# Altium project Remote_Sensor_Unit-v1.1.PrjPcb (part 2 of 4)

## Sheet Power_Sheet1.SchDoc
size A4; SheetNumber: 3; SheetTotal: 7
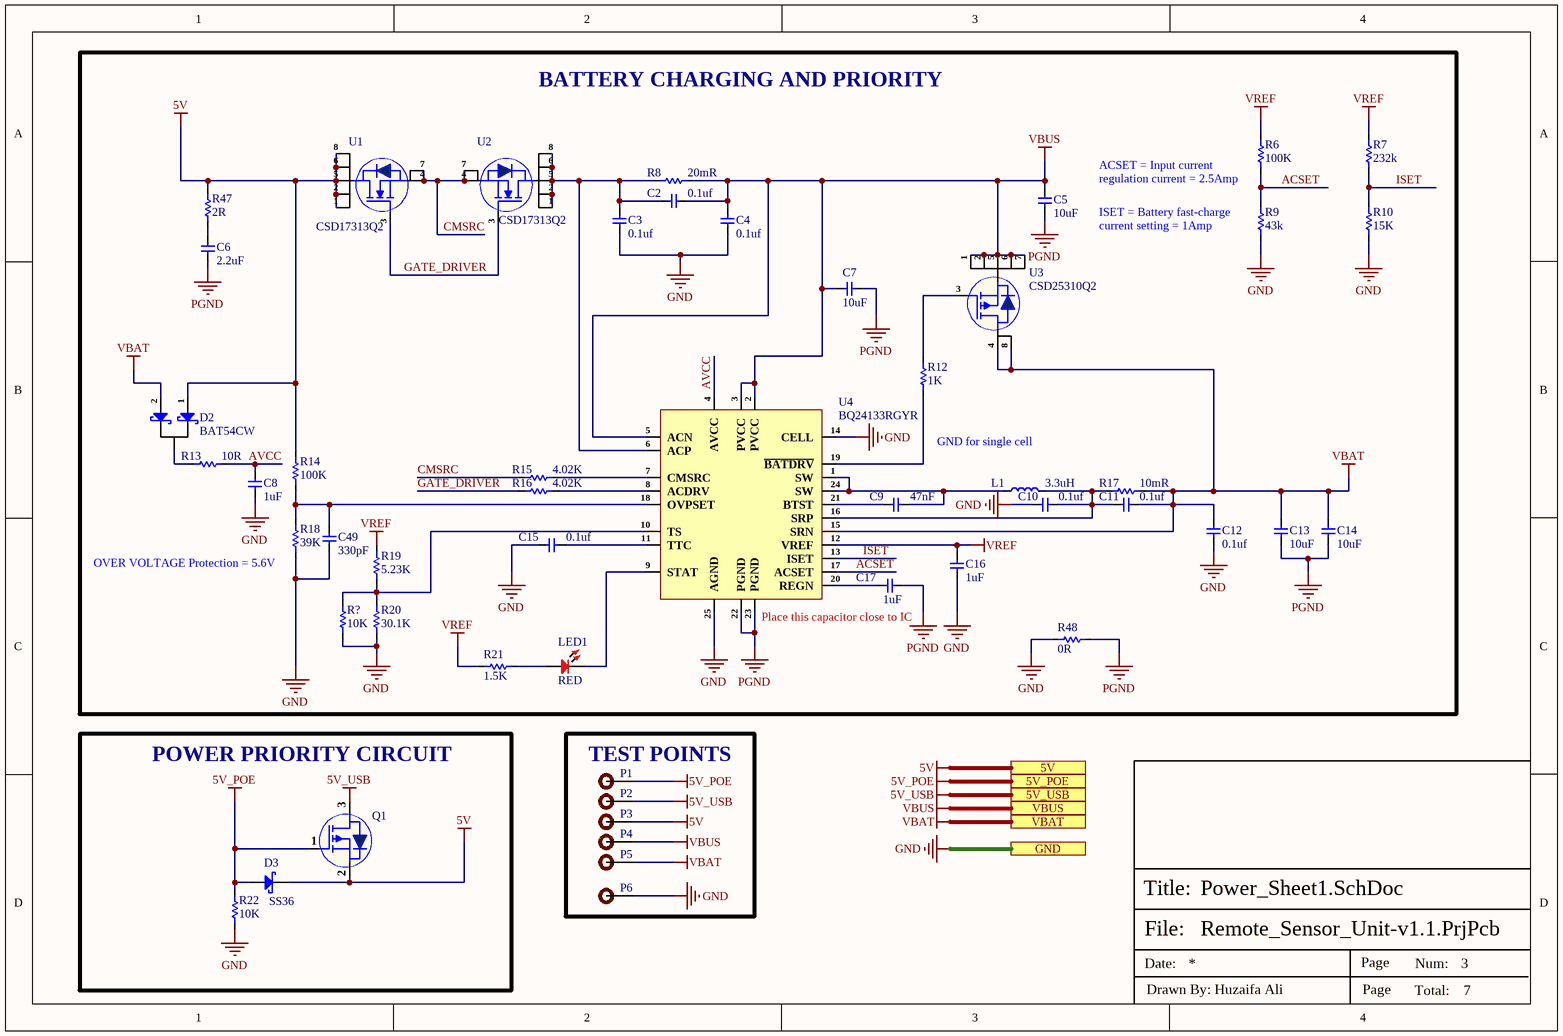
[diagram p2: Power_Sheet1.SchDoc]

### Parts
C2  0.1uf  [Cap-0402]
C3  0.1uf  [Cap-0402]
C4  0.1uf  [Cap-0402]
C5  10uF  [Cap-0402]
C6  2.2uF  [Cap-0805]
C7  10uF  [Cap-0402]
C8  1uF  [Cap-0402]
C9  47nF  [Cap-0402]
C10  0.1uf  [Cap-0402]
C11  0.1uf  [Cap-0402]
C12  0.1uf  [Cap-0402]
C13  10uF  [Cap-0402]
C14  10uF  [Cap-0402]
C15  0.1uf  [Cap-0402]
C16  1uF  [Cap-0402]
C17  1uF  [Cap-0402]
C49  330pF  [Cap-0603]
D2  BAT54CW  [SOT_323]
D3  SS36  [SMA]
L1  3.3uH  [VLS5045EX-3R3N]
LED1  RED  [LED-0603]
P1  TEST POINT  [Test-point]  (value not drawn)
P2  TEST POINT  [Test-point]  (value not drawn)
P3  TEST POINT  [Test-point]  (value not drawn)
P4  TEST POINT  [Test-point]  (value not drawn)
P5  TEST POINT  [Test-point]  (value not drawn)
P6  TEST POINT  [Test-point]  (value not drawn)
Q1  WPM3401-3/TR  [SOT-23-3L_]  (value not drawn)
R6  100K  [Res-0603]
R7  232k  [Res-0402]
R8  20mR  [Res-1206]
R9  43k  [Res-0402]
R10  15K  [Res-0402]
R12  1K  [Res-0201]
R13  10R  [RES-0805]
R14  100K  [Res-0603]
R15  4.02K  [Res-0402]
R16  4.02K  [Res-0402]
R17  10mR  [Res-1206]
R18  39K  [Res-0402]
R19  5.23K  [Res-0603]
R20  30.1K  [Res-0603]
R21  1.5K  [Res-0402]
R22  10K  [Res-0201]
R47  2R  [Res_1210]
R48  0R  [Res-0805]
R?  10K  [Res-0603]
U1  CSD17313Q2  [CSD17313Q2]
U2  CSD17313Q2  [CSD17313Q2]
U3  CSD25310Q2  [CSD25310Q2]
U4  BQ24133RGYR  [24-VQFN (5.5x3.5)]

### Blocks framed on the sheet
BATTERY CHARGING AND PRIORITY: C2-C17 C49 D2 L1 LED1 R6-R10 R12-R21 R47 R48 R? U1-U4
POWER PRIORITY CIRCUIT: D3 Q1 R22
TEST POINTS: P1-P6

### Ports
5V, 5V_POE, 5V_USB, GND, VBAT, VBUS

### Nets
5V: D2.1(A) D3.1(K) P3.1 Q1.2(S) R14.2 R47.2 U1.1(D) U1.2(D) U1.5(D) U1.6(D) U1.8(D) ; port 5V
5V_POE: D3.2(A) P1.1 Q1.1(G) R22.2 ; port 5V_POE
5V_USB: P2.1 Q1.3(D) ; port 5V_USB
GND: C3.2 C4.2 C8.2 C10.2 C12.2 C15.1 C16.1 C49.1 P6.1 R9.1 R10.1 R18.1 R20.1 R22.1 R48.1 R?.1 U4.14(CELL) U4.25(AGND) ; port GND
PGND: C5.2 C6.1 C7.1 C13.2 C14.2 C17.1 R48.2 U4.22(PGND) U4.23(PGND)
VBAT: C11.1 C12.1 C13.1 C14.1 D2.2(A) P5.1 R17.2 U3.4(D) U3.8(D) U4.15(SRN) ; port VBAT
VBUS: C2.1 C4.1 C5.1 C7.2 P4.1 R8.2 U3.1(S) U3.2(S) U3.5(S) U3.6(S) U3.7(S) U4.2(PVCC) U4.3(PVCC) U4.5(ACN) ; port VBUS
VREF: C16.2 R6.2 R7.2 R19.2 R21.1 U4.12(VREF)
ACSET: R6.1 R9.2 U4.17(ACSET)
AVCC: C8.1 R13.2 U4.4(AVCC)
CMSRC: R15.1 U1.4(S) U1.7(S) U2.4(S) U2.7(S)
GATE_DRIVER: R16.1 U1.3(G) U2.3(G)
ISET: R7.1 R10.2 U4.13(ISET)
NetC2_2: C2.2 C3.1 R8.1 U2.1(D) U2.2(D) U2.5(D) U2.6(D) U2.8(D) U4.6(ACP)
NetC6_2: C6.2 R47.1
NetC9_1: C9.1 U4.21(BTST)
NetC9_2: C9.2 L1.1 U4.1(SW) U4.24(SW)
NetC10_1: C10.1 C11.2 L1.2 R17.1 U4.16(SRP)
NetC15_2: C15.2 U4.11(TTC)
NetC17_2: C17.2 U4.20(REGN)
NetC49_2: C49.2 R14.1 R18.2 U4.18(OVPSET)
NetD2_3: D2.3(K) R13.1
NetLED1_1: LED1.1 R21.2
NetLED1_2: LED1.2 U4.9(STAT)
NetR12_1: R12.1 U3.3(G)
NetR12_2: R12.2 U4.19(~{BAT}~{DRV})
NetR15_2: R15.2 U4.7(CMSRC)
NetR16_2: R16.2 U4.8(ACDRV)
NetR19_1: R19.1 R20.2 R?.2 U4.10(TS)

### Notes on the sheet
- (near R6) ACSET = Input current regulation current = 2.5Amp
- (near R9) ISET = Battery fast-charge current setting = 1Amp
- GND for single cell
- (near R18) OVER VOLTAGE Protection = 5.6V
- (near U4) Place this capacitor close to IC
- File:
- Title:
- Date:
- Page
- Num:
- Total:
- Drawn By: Huzaifa Ali

### Library data of the parts
C2-C4 C10-C12 C15 = GRM155R62A104KE14D: CAP CER 0.1UF 100V X5R 0402; Manufacturer: Murata; Capacitance: 100nF; Tolerance: 10%; Item Type: Capacitor; Supplier 1: Arrow Electronics; Manufacturer Part Number: GRM155R62A104KE14D; RoHS: Yes; Category: Ceramic Capacitors; Stock 1: 870000; Pricing 1: 10000=0.00500, 20000=0.00410, 30000=0.00390, 50000=0.00370, 100000=0.00300 (USD); Mount: Surface Mount; Case/Package: 0402; Case Code (Metric): 1005; Case Code (Imperial): 0402; Weight: 0.000212oz; Min Operating Temperature: -55°C; Max Operating Temperature: 85°C; Packaging: Tape and Reel; Voltage Rating: 100V; Dielectric: X5R; Termination: SMD/SMT; Voltage Rating (DC): 100V; Package Quantity: 10000; Series: GRM; Length: 0.039inch; Width: 0.02inch; Height: 0.5mm; Thickness: 0.022inch; Reach SVHC Compliant: Yes; Lead Free: Lead Free; RoHS Compliant: Yes; ComponentLink1URL: http://www.farnell.com/datasheets/2079151.pdf?src-supplier=Farnell; ComponentLink1Description: http://www.farnell.com/datasheets/2079151.pdf?src-supplier=Farnell; ComponentLink2URL: http://www.mouser.com/ds/2/281/c02e-2905.pdf?src-supplier=Mouser; ComponentLink2Description: http://www.mouser.com/ds/2/281/c02e-2905.pdf?src-supplier=Mouser; ComponentLink3URL: http://www.farnell.com/datasheets/2079151.pdf?src-supplier=Element14; ComponentLink3Description: http://www.farnell.com/datasheets/2079151.pdf?src-supplier=Element14; ComponentLink4URL: http://search.murata.co.jp/Ceramy/image/img/A01X/G101/ENG/GRM155R62A104KE14-01.pdf?src-supplier=Digi-Key; ComponentLink4Description: http://search.murata.co.jp/Ceramy/image/img/A01X/G101/ENG/GRM155R62A104KE14-01.pdf?src-supplier=Digi-Key; ComponentLink5URL: http://www.farnell.com/datasheets/2079151.pdf?src-supplier=Newark; ComponentLink5Description: http://www.farnell.com/datasheets/2079151.pdf?src-supplier=Newark; Supplier Part Number 1: GRM155R62A104KE14D; LCSC Part Number: C162178
C5 C7 C13 C14 = CL05A106MP5NUNC: CAP CER 10UF 10V X5R 0402; Manufacturer: Samsung; Tolerance: 20%; Item Type: Capacitor; Supplier 1: Avnet; Manufacturer Part Number: CL05A106MP5NUNC; RoHS: Yes; Category: Ceramic Capacitors; Stock 1: 1729850; Pricing 1: 10000=0.02537 (USD); Mount: Surface Mount; Case/Package: 0402; Case Code (Metric): 1005; Case Code (Imperial): 0402; Contact Plating: Tin; Min Operating Temperature: -55°C; Max Operating Temperature: 85°C; Package Quantity: 1; Packaging: Tape and Reel; Capacitance: 10uF; Voltage Rating: 10V; Dielectric: X5R; Termination: Wraparound; Series: CL; Construction: Flat; Length: 1mm; Width: 0.02inch; Thickness: 0.028inch; Depth: 0.5mm; Radiation Hardening: No; Lead Free: Lead Free; RoHS Compliant: Yes; ComponentLink1URL: https://datasheet.ciiva.com/25721/cl05a106mp5nunc-25721584.pdf?src-supplier=Digi-Key; ComponentLink1Description: https://datasheet.ciiva.com/25721/cl05a106mp5nunc-25721584.pdf?src-supplier=Digi-Key; ComponentLink2URL: https://datasheet.ciiva.com/26838/getdatasheetpartid-745310-26838170.pdf?src-supplier=Verical; ComponentLink2Description: https://datasheet.ciiva.com/26838/getdatasheetpartid-745310-26838170.pdf?src-supplier=Verical; Supplier Part Number 1: CL05A106MP5NUNC; LCSC Part Number: C315248
C6 = CC0805KKX5R8BB225: CAP CER 2.2UF 25V X5R 0805; Manufacturer: Yageo; Tolerance: 10%; Supplier 1: Mouser; Manufacturer Part Number: CC0805KKX5R8BB225; RoHS: Yes; Category: Ceramic Capacitors; Stock 1: 2849; Pricing 1: 1=0.33000, 10=0.15100, 50=0.15100, 100=0.14800, 500=0.14600, 1000=0.14500, 3000=0.14400, 10000=0.14400 (USD); Mount: Surface Mount; Case/Package: 0805; Case Code (Metric): 2012; Case Code (Imperial): 0805; Min Operating Temperature: -55°C; Max Operating Temperature: 85°C; Capacitance: 2.2uF; Dielectric: X5R; Voltage Rating: 25V; Voltage Rating (DC): 25V; Packaging: Tape and Reel; Resistor Type: Ceramic; Series: CC; Construction: Flat; Length: 2mm; Width: 0.049inch; Height: 0.85mm; Depth: 1.25mm; Thickness: 0.057inch; Radiation Hardening: No; Lead Free: Lead Free; Halogen Free: Halogen Free; RoHS Compliant: Yes; ComponentLink1URL: https://datasheet.ciiva.com/11583/upy-gphc-x5r-4v-to-50v-12-11583590.pdf?src-supplier=Avnet; ComponentLink1Description: https://datasheet.ciiva.com/11583/upy-gphc-x5r-4v-to-50v-12-11583590.pdf?src-supplier=Avnet; Supplier Part Number 1: 603-CC805KKX5R8BB225; LCSC Part Number: C277526
C8 C16 C17 = UMK105CBJ105MV-F: CAP CER 1UF 50V X5R 0402; Manufacturer: Taiyo Yuden; Item Type: Capacitor; Supplier 1: Digi-Key; Manufacturer Part Number: UMK105CBJ105MV-F; Stock 1: 412061; Pricing 1: 1=0.27, 10=0.184, 50=0.1224, 100=0.104, 500=0.07342, 1000=0.06424, 2500=0.06118, 5000=0.05659 (USD); Lead Free: Lead Free; RoHS Compliant: Yes; ComponentLink1URL: http://www.farnell.com/datasheets/2801300.pdf?src-supplier=Newark; ComponentLink1Description: http://www.farnell.com/datasheets/2801300.pdf?src-supplier=Newark; ComponentLink2URL: http://www.farnell.com/datasheets/2801300.pdf?src-supplier=Farnell; ComponentLink2Description: http://www.farnell.com/datasheets/2801300.pdf?src-supplier=Farnell; ComponentLink3URL: https://ds.yuden.co.jp/TYCOMPAS/ut/detail?pn=UMK105CBJ105MV-F &amp;u=M&src-supplier=Digi-Key; ComponentLink3Description: https://ds.yuden.co.jp/TYCOMPAS/ut/detail?pn=UMK105CBJ105MV-F &amp;u=M&src-supplier=Digi-Key; Supplier Part Number 1: 587-6278-1-ND; LCSC Part Number: C2880413
C9 = GRM155R71E473KA88D: CAP CER 0.047UF 25V X7R 0402; Manufacturer: Murata; Material: Ceramic; Tolerance: 10%; Item Type: Capacitor; Supplier 1: Rs; Manufacturer Part Number: GRM155R71E473KA88D; RoHS: Yes; Category: Ceramic Capacitors; Stock 1: 10000; Pricing 1: 1000=0.00007, 8000=0.00900 (GBP); Mounting Technology: Surface Mount; Case/Package: 0402; Pins: 2; Case Code (Metric): 1005; Case Code (Imperial): 0402; Min Operating Temperature: -55°C; Max Operating Temperature: 125°C; Value: 47nF; Dielectric: X7R; Package Quantity: 1; Voltage Rating: 25V; Packaging: Tape and Reel; Termination: SMD/SMT; Voltage: 25V; Voltage Rating (DC): 25V; Series: GRM; Construction: Flat; Length: 1mm; Width: 0.02inch; Height: 0.5mm; Thickness: 0.022inch; Depth: 0.5mm; Radiation Hardening: No; Reach SVHC Compliant: Yes; Lead Free: Lead Free; RoHS Compliant: Yes; ComponentLink1URL: https://datasheet.ciiva.com/34302/1856425-34302854.pdf?src-supplier=Jameco; ComponentLink1Description: https://datasheet.ciiva.com/34302/1856425-34302854.pdf?src-supplier=Jameco; ComponentLink2URL: https://datasheet.ciiva.com/131/grm155r71e473ka88-01-131494.pdf?src-supplier=Digi-Key; ComponentLink2Description: https://datasheet.ciiva.com/131/grm155r71e473ka88-01-131494.pdf?src-supplier=Digi-Key; ComponentLink3URL: https://datasheet.ciiva.com/18184/getdatasheetpartid-153136-18184712.pdf?src-supplier=Verical; ComponentLink3Description: https://datasheet.ciiva.com/18184/getdatasheetpartid-153136-18184712.pdf?src-supplier=Verical; ComponentLink4URL: https://datasheet.ciiva.com/29199/454180-da-01-en-vs-kondensator-0402-29199826.pdf?src-supplier=Conrad; ComponentLink4Description: https://datasheet.ciiva.com/29199/454180-da-01-en-vs-kondensator-0402-29199826.pdf?src-supplier=Conrad; ComponentLink5URL: https://datasheet.ciiva.com/14103/grmseries-highdielectrictype-eng-14103754.pdf?src-supplier=Distrelec; ComponentLink5Description: https://datasheet.ciiva.com/14103/grmseries-highdielectrictype-eng-14103754.pdf?src-supplier=Distrelec; ComponentLink6URL: https://datasheet.ciiva.com/7937/608985-7937623.pdf?src-supplier=Element14; ComponentLink6Description: https://datasheet.ciiva.com/7937/608985-7937623.pdf?src-supplier=Element14; ComponentLink7URL: https://datasheet.ciiva.com/131/grm155r71e473ka88-01-131493.pdf?src-supplier=Digi-Key; ComponentLink7Description: https://datasheet.ciiva.com/131/grm155r71e473ka88-01-131493.pdf?src-supplier=Digi-Key; ComponentLink8URL: https://datasheet.ciiva.com/131/grm155r71e473ka88-01-131492.pdf?src-supplier=Digi-Key; ComponentLink8Description: https://datasheet.ciiva.com/131/grm155r71e473ka88-01-131492.pdf?src-supplier=Digi-Key; ComponentLink9URL: https://datasheet.ciiva.com/5424/product-5424844.pdf?src-supplier=Mouser; ComponentLink9Description: https://datasheet.ciiva.com/5424/product-5424844.pdf?src-supplier=Mouser; ComponentLink10URL: https://datasheet.ciiva.com/2989/product-2989395.pdf?src-supplier=Avnet; ComponentLink10Description: https://datasheet.ciiva.com/2989/product-2989395.pdf?src-supplier=Avnet; ComponentLink11URL: https://datasheet.ciiva.com/16213/product-16213823.pdf?src-supplier=Future+Electronics; ComponentLink11Description: https://datasheet.ciiva.com/16213/product-16213823.pdf?src-supplier=Future+Electronics; Supplier Part Number 1: 2478015P; LCSC Part Number: C77017
C49 = CC0603JRNPO9BN331: CAP CER 330PF 50V C0G/NPO 0603; Manufacturer: Yageo; Dielectric Material: Ceramic; Multilayer: Yes; Tolerance  (fill in as +-): 5%; Temperature Characteristics Code: C0G; Item Type: Capacitor; Supplier 1: Future Electronics; Manufacturer Part Number: CC0603JRNPO9BN331; RoHS: Yes; Category: Ceramic Capacitors; Stock 1: 40000; Pricing 1: 4000=0.00990, 16000=0.00940, 20000=0.00980, 40000=0.00910, 80000=0.00930, 100000=0.00880, 160000=0.00830, 200000=0.00900, 500000=0.00850 (USD); Mounting Technology: Surface Mount; Pins: 2; Package Shape: Rectangular; Case/Package: 0603; Terminal Finish: Nickel; Min Operating Temperature: -55°C; Max Operating Temperature: 125°C; JESD-609 Code: e3; Value: 330pF; Capacitor Type: Ceramic; Package Style: SMTMeter; Packaging: Tape and Reel; Tolerance (fill in as +-): 5%; Rated DC Voltage (URdc): 50V; Termination: Wraparound; Length: 1.6mm; Width: 0.8mm; Height: 0.8mm; Reach SVHC Compliant: Yes; RoHS Compliant: Yes; ComponentLink1URL: https://datasheet.ciiva.com:443/pdfs/VipMasterIC/IC/YAGO/YAGO-S-A0009251638/YAGO-S-A0009251638-1.pdf?src-supplier=IHS+Markit; ComponentLink1Description: https://datasheet.ciiva.com:443/pdfs/VipMasterIC/IC/YAGO/YAGO-S-A0009251638/YAGO-S-A0009251638-1.pdf?src-supplier=IHS+Markit; ComponentLink2URL: https://datasheet.ciiva.com/28450/1443161-28450501.pdf?src-supplier=Element14; ComponentLink2Description: https://datasheet.ciiva.com/28450/1443161-28450501.pdf?src-supplier=Element14; ComponentLink3URL: https://datasheet.ciiva.com/144/mlccorderingcode-144957.pdf?src-supplier=Digi-Key; ComponentLink3Description: https://datasheet.ciiva.com/144/mlccorderingcode-144957.pdf?src-supplier=Digi-Key; ComponentLink4URL: https://datasheet.ciiva.com/144/mlccorderingcode-144956.pdf?src-supplier=Digi-Key; ComponentLink4Description: https://datasheet.ciiva.com/144/mlccorderingcode-144956.pdf?src-supplier=Digi-Key; ComponentLink5URL: https://datasheet.ciiva.com/144/mlccorderingcode-144958.pdf?src-supplier=Digi-Key; ComponentLink5Description: https://datasheet.ciiva.com/144/mlccorderingcode-144958.pdf?src-supplier=Digi-Key; ComponentLink6URL: https://datasheet.ciiva.com/8033/1443161-8033739.pdf?src-supplier=Element14; ComponentLink6Description: https://datasheet.ciiva.com/8033/1443161-8033739.pdf?src-supplier=Element14; ComponentLink7URL: https://datasheet.ciiva.com/8033/1443161-8033737.pdf?src-supplier=Element14; ComponentLink7Description: https://datasheet.ciiva.com/8033/1443161-8033737.pdf?src-supplier=Element14; ComponentLink8URL: https://datasheet.ciiva.com/13389/upy-gp-np0-16v-to-50v-8-13389983.pdf?src-supplier=Mouser; ComponentLink8Description: https://datasheet.ciiva.com/13389/upy-gp-np0-16v-to-50v-8-13389983.pdf?src-supplier=Mouser; ComponentLink9URL: https://datasheet.ciiva.com/11587/upy-gp-np0-16v-to-50v-8-11587326.pdf?src-supplier=Avnet; ComponentLink9Description: https://datasheet.ciiva.com/11587/upy-gp-np0-16v-to-50v-8-11587326.pdf?src-supplier=Avnet; ComponentLink10URL: https://datasheet.ciiva.com/26829/getdatasheetpartid-403533-26829382.pdf?src-supplier=Verical; ComponentLink10Description: https://datasheet.ciiva.com/26829/getdatasheetpartid-403533-26829382.pdf?src-supplier=Verical; Supplier Part Number 1: 8843708; LCSC Part Number: C62784
D2 = BAT54CW: DIODE SCHOTTKY 30V 100MA SOT323; Manufacturer: ON Semiconductor / Fairchild; Manufacturer Part Number: BAT54CWT1G; Element Configuration: Common Cathode; Forward Current: 200mA; Forward Voltage: 800mV; Reverse Recovery Time: 5ns; Peak Non-Repetitive Surge Current: 600mA; Max Reverse Current: 2uA; Power Dissipation: 200mW; Supplier 1: Mouser; RoHS: Yes; Category: Schottky Diodes; Pricing 1: 1=0.22000, 10=0.18400, 50=0.18400, 100=0.09800, 500=0.06400, 1000=0.04400, 3000=0.03400, 10000=0.03400 (USD); Mount: Surface Mount; Case/Package: SOT-323; Number of Pins: 3; Contact Plating: Tin,Matte; Weight: 0.03g; Min Operating Temperature: -55°C; Max Operating Temperature: 125°C; Packaging: Tape and Reel; Package Quantity: 1; Max Repetitive Reverse Voltage (Vrrm): 30V; Average Rectified Current: 200mA; Max Forward Surge Current (Ifsm): 600mA; Max Reverse Voltage (DC): 30V; Max Surge Current: 600mA; Max Reverse Leakage Current: 2uA; Series: -; Recovery Time: 5ns; Length: 2.2mm; Width: 1.35mm; Height: 0.9mm; Radiation Hardening: No; RoHS Compliant: Yes; Lead Free: Lead Free; REACH SVHC: No SVHC; ComponentLink1URL: https://datasheet.ciiva.com/905/bat54cwt1-d-905845.pdf?src-supplier=Digi-Key; ComponentLink1Description: https://datasheet.ciiva.com/905/bat54cwt1-d-905845.pdf?src-supplier=Digi-Key; ComponentLink2URL: https://datasheet.ciiva.com/28381/1708235-28381253.pdf?src-supplier=Element14; ComponentLink2Description: https://datasheet.ciiva.com/28381/1708235-28381253.pdf?src-supplier=Element14; ComponentLink3URL: https://datasheet.ciiva.com/22651/1706529-22651951.pdf?src-supplier=Element14; ComponentLink3Description: https://datasheet.ciiva.com/22651/1706529-22651951.pdf?src-supplier=Element14; ComponentLink4URL: https://datasheet.ciiva.com/4715/bat54cwt1g-102392-4715466.pdf?src-supplier=Mouser; ComponentLink4Description: https://datasheet.ciiva.com/4715/bat54cwt1g-102392-4715466.pdf?src-supplier=Mouser; ComponentLink5URL: https://datasheet.ciiva.com/4715/bat54cwt1-d-111181-4715156.pdf?src-supplier=Mouser; ComponentLink5Description: https://datasheet.ciiva.com/4715/bat54cwt1-d-111181-4715156.pdf?src-supplier=Mouser; ComponentLink6URL: https://datasheet.ciiva.com/22659/1708235-22659015.pdf?src-supplier=Element14; ComponentLink6Description: https://datasheet.ciiva.com/22659/1708235-22659015.pdf?src-supplier=Element14; ComponentLink7URL: https://datasheet.ciiva.com/8303/bat54cwt1g-8303708.pdf?src-supplier=Avnet; ComponentLink7Description: https://datasheet.ciiva.com/8303/bat54cwt1g-8303708.pdf?src-supplier=Avnet; ComponentLink8URL: https://datasheet.ciiva.com/8303/bat54cwt1g-8303706.pdf?src-supplier=Avnet; ComponentLink8Description: https://datasheet.ciiva.com/8303/bat54cwt1g-8303706.pdf?src-supplier=Avnet; ComponentLink9URL: https://datasheet.ciiva.com/6390/bat54cwt1g-6390474.pdf?src-supplier=Digi-Key; ComponentLink9Description: https://datasheet.ciiva.com/6390/bat54cwt1g-6390474.pdf?src-supplier=Digi-Key; ComponentLink10URL: https://datasheet.ciiva.com/905/bat54cwt1-d-905846.pdf?src-supplier=Digi-Key; ComponentLink10Description: https://datasheet.ciiva.com/905/bat54cwt1-d-905846.pdf?src-supplier=Digi-Key; ComponentLink11URL: https://datasheet.ciiva.com/905/bat54cwt1-d-905847.pdf?src-supplier=Digi-Key; ComponentLink11Description: https://datasheet.ciiva.com/905/bat54cwt1-d-905847.pdf?src-supplier=Digi-Key; Supplier Part Number 1: 863-BAT54CWT1G; LCSC Part Number: C77321; Item Type: Diode
D3 = SS36: Schottky Barrier Diode SK36, DO-214AB, 3A/60V; Manufacturer: ON Semiconductor / Fairchild; Output Current: 3A; Element Configuration: Single; Forward Voltage: 750mV; Max Repetitive Reverse Voltage (Vrrm): 60V; Max Forward Surge Current (Ifsm): 100A; Max Reverse Current: 500uA; Polarity: Standard; Power Dissipation: 2.27W; Supplier 1: Rs; Manufacturer Part Number: SS36; RoHS: Yes; Category: Schottky Diodes; Stock 1: 100; Pricing 1: 100=0.43800, 500=0.34200, 1000=0.27800, 3000=0.25000 (GBP); Mount: Surface Mount; Case/Package: SMC; Number of Pins: 2; Min Operating Temperature: -55°C; Max Operating Temperature: 150°C; Packaging: Tape and Reel; Package Quantity: 3000; Series: -; Forward Current: 3A; Peak Non-Repetitive Surge Current: 100A; Voltage Rating (DC): 60V; Current Rating: 3A; Max Surge Current: 100A; Average Rectified Current: 3A; Max Reverse Leakage Current: 500uA; Max Reverse Voltage (DC): 60V; Current: 3A; Voltage: 60V; Radiation Hardening: No; RoHS Compliant: Yes; Reach SVHC Compliant: Yes; Lead Free: Lead Free; ComponentLink1URL: https://datasheet.ciiva.com/4714/ss36-197193-4714610.pdf?src-supplier=Mouser; ComponentLink1Description: https://datasheet.ciiva.com/4714/ss36-197193-4714610.pdf?src-supplier=Mouser; ComponentLink2URL: https://datasheet.ciiva.com/16889/ss36-16889545.pdf?src-supplier=Future+Electronics; ComponentLink2Description: https://datasheet.ciiva.com/16889/ss36-16889545.pdf?src-supplier=Future+Electronics; ComponentLink3URL: https://datasheet.ciiva.com/920/ss34-920433.pdf?src-supplier=Digi-Key; ComponentLink3Description: https://datasheet.ciiva.com/920/ss34-920433.pdf?src-supplier=Digi-Key; ComponentLink4URL: https://datasheet.ciiva.com/920/ss34-920434.pdf?src-supplier=Digi-Key; ComponentLink4Description: https://datasheet.ciiva.com/920/ss34-920434.pdf?src-supplier=Digi-Key; ComponentLink5URL: https://datasheet.ciiva.com/920/ss34-920435.pdf?src-supplier=Digi-Key; ComponentLink5Description: https://datasheet.ciiva.com/920/ss34-920435.pdf?src-supplier=Digi-Key; Supplier Part Number 1: 9034425P; LCSC Part Number: C16015; Item Type: Diode
L1 = VLS5045EX-3R3N: FIXED IND 3.3UH 4.2A 35.1MOHM SM; Manufacturer: TDK; Core Material: Ferrite; Saturation Current: 5.2A; Shielding: Shielded; DC Resistance (DCR): 35.1mR; Test Frequency: 100kHz; Tolerance: 30%; Item Type: Inductor; Supplier: Digi-Key; Supplier Part Number: 445-174398-1-ND; Manufacturer Part Number: VLS5045EX-3R3N; RoHS: Yes; Category: Fixed Inductors; Stock: 140631; Pricing: 1=0.42, 10=0.371, 25=0.3448, 50=0.2916, 100=0.2651, 250=0.2492, 500=0.2227 (USD); Mounting Technology: Surface Mount; Case/Package: Nonstandard; Min Operating Temperature: -40°C; Max Operating Temperature: 105°C; Packaging: Cut Tape; Value: 3.3uH; Series: VLS-EX; RoHS Compliant: Yes; ComponentLink1URL: http://www.farnell.com/datasheets/2339796.pdf?src-supplier=Farnell; ComponentLink1Description: http://www.farnell.com/datasheets/2339796.pdf?src-supplier=Farnell; ComponentLink2URL: https://media.digikey.com/pdf/Data%20Sheets/TDK%20PDFs/VLS-EX_Series_Br.pdf?src-supplier=Digi-Key; ComponentLink2Description: https://media.digikey.com/pdf/Data%20Sheets/TDK%20PDFs/VLS-EX_Series_Br.pdf?src-supplier=Digi-Key; ComponentLink3URL: http://www.farnell.com/datasheets/2339796.pdf?src-supplier=Element14; ComponentLink3Description: http://www.farnell.com/datasheets/2339796.pdf?src-supplier=Element14; ComponentLink4URL: http://www.farnell.com/datasheets/2339796.pdf?src-supplier=Newark; ComponentLink4Description: http://www.farnell.com/datasheets/2339796.pdf?src-supplier=Newark; LCSC Part Number: C307875
LED1 = 19-21/R7C-AK1L2BY/3T: Red 632nm LED Indication - Discrete 2.05V 0603 (1608 Metric); Manufacturer: Everlight Elec; Manufacturer Part Number: 19-21/R7C-AK1L2BY/3T; Package: 0603; LCSC Part Number: C1322287; Item Type: LED; ComponentLink1Description: LCSC; ComponentLink1URL: https://www.lcsc.com/product-detail/Light-Emitting-Diodes-LED_Everlight-Elec-19-21-R7C-AK1L2BY-3T_C1322287.html
P1-P6 = TEST POINT: Test Point ON
Q1 = WPM3401-3/TR: 30V 4.6A 38mΩ@10V,4.3A 1.3W 1V@250uA 90pF@15V P Channel 1.25nF@15V 24.8nC@10V +150℃@(Tj) SOT-23-3L MOSFETs ROHS; Manufacturer: WILLSEMI; Item Type: Mosfet; Manufacturer Part Number: WPM3401-3/TR; Footprint: SOT-23-3L; ComponentLink1Description: LCSC; ComponentLink1URL: https://www.lcsc.com/product-detail/MOSFETs_WILLSEMI-Will-Semicon-WPM3401-3-TR_C506235.html; LCSC Part Number: C506235
R6 R14 = RT0603BRD07100KL: RES SMD 100K OHM 0.1% 1/10W 0603; Manufacturer: Yageo; Resistance: 100kR; Temperature Coefficient: 25ppm/°C; Voltage Rating (DC): 75V; Power Rating: 100mW; Item Type: Resistor; Supplier 1: Digi-Key; Manufacturer Part Number: RT0603BRD07100KL; Stock 1: 53395; Pricing 1: 1=0.39, 10=0.332, 100=0.1298, 1000=0.05435, 2500=0.04982 (USD); Mount: Surface Mount; Case/Package: 0603; Case Code (Imperial): 0603; Case Code (Metric): 1608; Min Operating Temperature: -55°C; Max Operating Temperature: 125°C; Tolerance: 0.1%; Composition: Thin Film; Packaging: Tape and Reel; Voltage Rating: 75V; Package Quantity: 5000; Termination: SMD/SMT; Number of Terminations: 2; Military Standard: Not; Max Power Dissipation: 100mW; Working Voltage: 75V; Features: Moisture Resistant; Length: 1.6mm; Height: 0.022inch; Width: 0.031inch; Depth: 0.8mm; Lead Free: Lead Free; ComponentLink1URL: http://documents.rs-components.com/techlib://itc_doclist_GB.htm?stockno=6174810&src-supplier=RSComponents; ComponentLink1Description: http://documents.rs-components.com/techlib://itc_doclist_GB.htm?stockno=6174810&src-supplier=RSComponents; Supplier Part Number 1: YAG1235CT-ND; LCSC Part Number: C122538
R7 = RT0402BRD07232KL: RES 232K OHM 0.1% 1/16W 0402; Manufacturer: Yageo; Item Type: Resistor; Supplier: Mouser; Supplier Part Number: 603-RT0402BRD07232KL; Manufacturer Part Number: RT0402BRD07232KL; RoHS: Yes; Category: Chip SMD Resistors; Stock: 9850; Pricing: 1=0.47, 10=0.338, 50=0.338, 100=0.135, 1000=0.067, 10000=0.048 (USD); ComponentLink1URL: https://datasheet.octopart.com/RT0402BRD07232KL-Yageo-datasheet-166250672.pdf?src-supplier=Future+Electronics; ComponentLink1Description: https://datasheet.octopart.com/RT0402BRD07232KL-Yageo-datasheet-166250672.pdf?src-supplier=Future+Electronics; LCSC Part Number: C852652
R8 = PA1206FRF470R02L: RES 0.02 OHM 1% 1W 1206; Manufacturer: Yageo; Item Type: Resistor; Supplier: Avnet; Supplier Part Number: 58AK7653; Manufacturer Part Number: PA1206FRF470R02L; RoHS: No; Category: Chip SMD Resistors; Stock: 4000; Pricing: 1=0.541 (USD); LCSC Part Number: C728292
R9 = RC0402FR-0743KL: RES 43K OHM 1% 1/16W 0402; Manufacturer: Yageo; Resistance: 43kR; Power Rating: 63mW; Voltage Rating: 50V; Temperature Coefficient: 100ppm/°C; Item Type: Resistor; Supplier 1: Digi-Key; Manufacturer Part Number: RC0402FR-0743KL; RoHS: Yes; Category: Chip SMD Resistors; Stock 1: 923044; Pricing 1: 1=0.10000, 10=0.01400, 100=0.00580, 1000=0.00262, 2500=0.00228, 5000=0.00188 (USD); Case/Package: 0402; Case Code (Metric): 1005; Case Code (Imperial): 0402; Weight: 2.3E-05oz; Size Code: 0402; Min Operating Temperature: -55°C; Max Operating Temperature: 155°C; Resistor Type: Thick Film; Package Quantity: 1; Tolerance: 1%; Packaging: Tape and Reel; Number of Terminations: 2; Termination: SMD/SMT; Max Power Dissipation: 63mW; Voltage Rating (DC): 50V; Features: Moisture Resistant; Series: RC; Construction: Rectangular; Resistance Tolerance: 1%; Technology: THICK FILM; Length: 1mm; Width: 0.02inch; Height: 0.016inch; Depth: 0.5mm; RoHS Compliant: Yes; Military Standard: Not; Lead Free: Lead Free; ComponentLink1URL: https://datasheet.ciiva.com/11819/0900766b80c66297-11819515.pdf?src-supplier=RSComponents; ComponentLink1Description: https://datasheet.ciiva.com/11819/0900766b80c66297-11819515.pdf?src-supplier=RSComponents; ComponentLink2URL: https://datasheet.ciiva.com/7850/1018594-7850009.pdf?src-supplier=Element14; ComponentLink2Description: https://datasheet.ciiva.com/7850/1018594-7850009.pdf?src-supplier=Element14; ComponentLink3URL: https://datasheet.ciiva.com/7850/1018594-7850008.pdf?src-supplier=Element14; ComponentLink3Description: https://datasheet.ciiva.com/7850/1018594-7850008.pdf?src-supplier=Element14; ComponentLink4URL: https://datasheet.ciiva.com/2453/pyu-r-int-thick-7-2453665.pdf?src-supplier=Digi-Key; ComponentLink4Description: https://datasheet.ciiva.com/2453/pyu-r-int-thick-7-2453665.pdf?src-supplier=Digi-Key; ComponentLink5URL: https://datasheet.ciiva.com/2453/pyu-r-int-thick-7-2453666.pdf?src-supplier=Digi-Key; ComponentLink5Description: https://datasheet.ciiva.com/2453/pyu-r-int-thick-7-2453666.pdf?src-supplier=Digi-Key; ComponentLink6URL: https://datasheet.ciiva.com/2453/pyu-r-int-thick-7-2453664.pdf?src-supplier=Digi-Key; ComponentLink6Description: https://datasheet.ciiva.com/2453/pyu-r-int-thick-7-2453664.pdf?src-supplier=Digi-Key; Supplier Part Number 1: 311-43.0KLRCT-ND; LCSC Part Number: C185415
R10 = RT0402BRD0715KL: RES SMD 15K OHM 0.1% 1/16W 0402; Manufacturer: Yageo; Item Type: Resistor; Supplier: Arrow Electronics; Supplier Part Number: RT0402BRD0715KL; Manufacturer Part Number: RT0402BRD0715KL; RoHS: Yes; Category: Chip SMD Resistors; Stock: 10000; Pricing: 10000=0.0361, 30000=0.0357, 50000=0.0243, 100000=0.0205 (USD); ComponentLink1URL: https://datasheet.ciiva.com/12723/pyu-rt-1-to-0-05-rohs-l-4-12723782.pdf?src-supplier=Mouser; ComponentLink1Description: https://datasheet.ciiva.com/12723/pyu-rt-1-to-0-05-rohs-l-4-12723782.pdf?src-supplier=Mouser; ComponentLink2URL: https://datasheet.ciiva.com/2582/pyu-rt-1-to-0-05-rohs-l-5-2582151.pdf?src-supplier=Digi-Key; ComponentLink2Description: https://datasheet.ciiva.com/2582/pyu-rt-1-to-0-05-rohs-l-5-2582151.pdf?src-supplier=Digi-Key; LCSC Part Number: C852545
R12 = RC0201FR-071KP: RES 1K OHM 1% 1/20W 0201; Manufacturer: Yageo; Supplier 1: Digi-Key; Manufacturer Part Number: RC0201FR-071KP; RoHS: Yes; Stock 1: 4800; Pricing 1: 1=0.11000, 10=0.10200, 100=0.03940, 1000=0.01734, 2500=0.01497, 5000=0.01340 (USD); RoHS Compliant: Yes; Supplier Part Number 1: 13-RC0201FR-071KPCT-ND; LCSC Part Number: C3953443
R13 = TNPW080510R0FEEA: RES 10 OHM 1% 1/8W 0805; Manufacturer: Vishay; Power Rating: 125mW; Voltage Rating: 150V; Temperature Coefficient: 25ppm/°C; Item Type: Resistor; Supplier 1: Mouser; Manufacturer Part Number: TNPW080510R0FEEA; RoHS: Yes; Category: Chip SMD Resistors; Stock 1: 22670; Pricing 1: 1=0.57000, 10=0.43800, 50=0.43800, 100=0.18500, 500=0.13400, 1000=0.10200, 2500=0.09600, 5000=0.08500, 10000=0.08500 (USD); Mounting Technology: Surface Mount; Case/Package: 0805; Case Code (Imperial): 0805; Case Code (Metric): 2012; Weight: 0.000194oz; Contact Plating: Tin; Min Operating Temperature: -55°C; Max Operating Temperature: 125°C; Value: 10R; Tolerance: 1%; Packaging: Tape and Reel; Resistor Type: Thin Film; Termination: SMD/SMT; Series: TNPW e3; Technology: THIN FILM; Length: 2mm; Width: 1.2mm; Height: 0.45mm; Depth: 1.25mm; Radiation Hardening: No; Lead Free: Lead Free; RoHS Compliant: Yes; ComponentLink1URL: https://datasheet.ciiva.com/16787/70201627-16787918.pdf?src-supplier=Allied+Electronics; ComponentLink1Description: https://datasheet.ciiva.com/16787/70201627-16787918.pdf?src-supplier=Allied+Electronics; Supplier Part Number 1: 71-TNPW080510R0FEEA; LCSC Part Number: C844061
R15 R16 = RC0402FR-074K02L: RES 4.02K OHM 1% 1/16W 0402; Manufacturer: Yageo; Resistance: 4.02kR; Temperature Coefficient: 100ppm/°C; Power Rating: 62.5mW; Voltage Rating: 50V; Max Power Dissipation: 63mW; Supplier 1: Mouser; Manufacturer Part Number: RC0402FR-074K02L; RoHS: Yes; Category: Chip SMD Resistors; Stock 1: 302754; Pricing 1: 1=0.10000, 10=0.01200, 50=0.01200, 100=0.00500, 1000=0.00300, 2500=0.00200, 10000=0.00100 (USD); Case/Package: 0402; Contact Plating: Tin,Matte; Case Code (Metric): 1005; Case Code (Imperial): 0402; Min Operating Temperature: -55°C; Max Operating Temperature: 155°C; Tolerance: 1%; Resistor Type: Thick Film; Packaging: Tape and Reel; Package Quantity: 1; Number of Terminations: 2; Termination: SMD/SMT; Working Voltage: 50V; Features: Moisture Resistant; Series: RC; Construction: Rectangular; Technology: THICK FILM; Length: 1mm; Width: 0.02inch; Height: 0.016inch; Depth: 0.5mm; Military Standard: Not; Lead Free: Lead Free; RoHS Compliant: Yes; ComponentLink1URL: https://datasheet.ciiva.com/2553/pyu-r-int-thick-7-2553258.pdf?src-supplier=Digi-Key; ComponentLink1Description: https://datasheet.ciiva.com/2553/pyu-r-int-thick-7-2553258.pdf?src-supplier=Digi-Key; ComponentLink2URL: https://datasheet.ciiva.com/2553/pyu-r-int-thick-7-2553259.pdf?src-supplier=Digi-Key; ComponentLink2Description: https://datasheet.ciiva.com/2553/pyu-r-int-thick-7-2553259.pdf?src-supplier=Digi-Key; ComponentLink3URL: https://datasheet.ciiva.com/2553/pyu-r-int-thick-7-2553257.pdf?src-supplier=Digi-Key; ComponentLink3Description: https://datasheet.ciiva.com/2553/pyu-r-int-thick-7-2553257.pdf?src-supplier=Digi-Key; ComponentLink4URL: https://datasheet.ciiva.com/12668/pyu-rc0402-51-rohs-l-6-r-12668204.pdf?src-supplier=Mouser; ComponentLink4Description: https://datasheet.ciiva.com/12668/pyu-rc0402-51-rohs-l-6-r-12668204.pdf?src-supplier=Mouser; ComponentLink5URL: https://datasheet.ciiva.com/16741/pyu-rc0402-51-rohs-l-6-r-16741438.pdf?src-supplier=Future+Electronics; ComponentLink5Description: https://datasheet.ciiva.com/16741/pyu-rc0402-51-rohs-l-6-r-16741438.pdf?src-supplier=Future+Electronics; Supplier Part Number 1: 603-RC0402FR-074K02L; LCSC Part Number: C137968
R17 = PE1206FRM470R01L: RES 0.01 OHM 1% 1W 1206; Manufacturer: Yageo; Item Type: Resistor; Supplier: Digi-Key; Supplier Part Number: 13-PE1206FRM470R01LCT-ND; Manufacturer Part Number: PE1206FRM470R01L; RoHS: Yes; Category: Chip SMD Resistors; Stock: 18092; Pricing: 1=0.8, 10=0.692, 25=0.608, 50=0.5556, 100=0.4823, 250=0.41936, 500=0.34806, 1000=0.28306 (USD); ComponentLink1URL: http://www.mouser.com/ds/2/447/PYu-PE_521_RoHS_L_5-1077989.pdf?src-supplier=Mouser; ComponentLink1Description: http://www.mouser.com/ds/2/447/PYu-PE_521_RoHS_L_5-1077989.pdf?src-supplier=Mouser; ComponentLink2URL: http://www.yageo.com/documents/recent/PYu-PE_521_RoHS_L_5.pdf?src-supplier=Digi-Key; ComponentLink2Description: http://www.yageo.com/documents/recent/PYu-PE_521_RoHS_L_5.pdf?src-supplier=Digi-Key; ComponentLink3URL: https://datasheet.octopart.com/PE1206FRM470R01L-Yageo-datasheet-152583588.pdf?src-supplier=Future+Electronics; ComponentLink3Description: https://datasheet.octopart.com/PE1206FRM470R01L-Yageo-datasheet-152583588.pdf?src-supplier=Future+Electronics; LCSC Part Number: C875668
R18 = RC0402FR-0739KL: RES 39K OHM 1% 1/16W 0402; Manufacturer: Yageo; Voltage Rating: 50V; Resistance: 39kR; Power Rating: 63mW; Temperature Coefficient: 100ppm/°C; Supplier 1: Mouser; Manufacturer Part Number: RC0402FR-0739KL; RoHS: Yes; Category: Chip SMD Resistors; Stock 1: 177055; Pricing 1: 1=0.10000, 10=0.01200, 50=0.01200, 100=0.00500, 1000=0.00300, 2500=0.00200, 10000=0.00100 (USD); Case/Package: 0402; Case Code (Metric): 1005; Case Code (Imperial): 0402; Size Code: 0402; Min Operating Temperature: -55°C; Max Operating Temperature: 155°C; Packaging: Tape and Reel; Tolerance: 1%; Package Quantity: 1; Resistor Type: Thick Film; Number of Terminations: 2; Termination: SMD/SMT; Max Power Dissipation: 63mW; Features: Moisture Resistant; Series: RC; Resistance Tolerance: 1%; Construction: Rectangular; Technology: THICK FILM; Length: 1mm; Width: 0.02inch; Height: 0.016inch; Depth: 0.5mm; RoHS Compliant: Yes; REACH SVHC: Unknown; Military Standard: Not; Lead Free: Lead Free; ComponentLink1URL: https://datasheet.ciiva.com/11819/0900766b80c66297-11819480.pdf?src-supplier=RSComponents; ComponentLink1Description: https://datasheet.ciiva.com/11819/0900766b80c66297-11819480.pdf?src-supplier=RSComponents; ComponentLink2URL: https://datasheet.ciiva.com/2553/pyu-r-int-thick-7-2553207.pdf?src-supplier=Digi-Key; ComponentLink2Description: https://datasheet.ciiva.com/2553/pyu-r-int-thick-7-2553207.pdf?src-supplier=Digi-Key; ComponentLink3URL: https://datasheet.ciiva.com/2553/pyu-r-int-thick-7-2553208.pdf?src-supplier=Digi-Key; ComponentLink3Description: https://datasheet.ciiva.com/2553/pyu-r-int-thick-7-2553208.pdf?src-supplier=Digi-Key; ComponentLink4URL: https://datasheet.ciiva.com/2553/pyu-r-int-thick-7-2553206.pdf?src-supplier=Digi-Key; ComponentLink4Description: https://datasheet.ciiva.com/2553/pyu-r-int-thick-7-2553206.pdf?src-supplier=Digi-Key; ComponentLink5URL: https://datasheet.ciiva.com/12668/pyu-rc0402-51-rohs-l-6-r-12668186.pdf?src-supplier=Mouser; ComponentLink5Description: https://datasheet.ciiva.com/12668/pyu-rc0402-51-rohs-l-6-r-12668186.pdf?src-supplier=Mouser; ComponentLink6URL: https://datasheet.ciiva.com/7849/1018594-7849980.pdf?src-supplier=Element14; ComponentLink6Description: https://datasheet.ciiva.com/7849/1018594-7849980.pdf?src-supplier=Element14; ComponentLink7URL: https://datasheet.ciiva.com/7849/1018594-7849981.pdf?src-supplier=Element14; ComponentLink7Description: https://datasheet.ciiva.com/7849/1018594-7849981.pdf?src-supplier=Element14; ComponentLink8URL: https://datasheet.ciiva.com/16941/pyu-rc0402-51-rohs-l-6-r-16941400.pdf?src-supplier=Future+Electronics; ComponentLink8Description: https://datasheet.ciiva.com/16941/pyu-rc0402-51-rohs-l-6-r-16941400.pdf?src-supplier=Future+Electronics; Supplier Part Number 1: 603-RC0402FR-0739KL; LCSC Part Number: C137995
R19 = FRC0603F5231TS: 100mW Thick Film Resistors ±1% 5.23kΩ 0603 Chip Resistor - Surface Mount ROHS; Manufacturer: FOJAN; Manufacturer Part Number: FRC0603F5231TS; Package: 0603; LCSC Part Number: C2930111; ComponentLink1Description: LCSC; ComponentLink1URL: https://www.lcsc.com/product-detail/Chip-Resistor-Surface-Mount_FOJAN-FRC0603F5231TS_C2930111.html; Item Type: Resistor
R20 = RC0603FR-0730K1L: RES 30.1K OHM 1% 1/10W 0603; Manufacturer: Yageo; Item Type: Resistor; Supplier: Future Electronics; Supplier Part Number: 5666516; Manufacturer Part Number: RC0603FR-0730K1L; RoHS: Yes; Category: Chip SMD Resistors; Stock: 2160000; Pricing: 5000=0.0015, 50000=0.0014, 200000=0.0014, 625000=0.0013, 2000000=0.0012 (USD); ComponentLink1URL: https://datasheet.ciiva.com/11808/0900766b80f96399-11808101.pdf?src-supplier=Rs; ComponentLink1Description: https://datasheet.ciiva.com/11808/0900766b80f96399-11808101.pdf?src-supplier=Rs; LCSC Part Number: C137745
R21 = RC0402FR-071K5L: RES 1.5K OHM 1% 1/16W 0402; Manufacturer: Yageo; Resistance: 1.5kR; Power Rating: 62.5mW; Voltage Rating: 50V; Temperature Coefficient: 100ppm/°C; Max Power Dissipation: 63mW; Supplier 1: Digi-Key; Manufacturer Part Number: RC0402FR-071K5L; RoHS: Yes; Category: Chip SMD Resistors; Stock 1: 2832947; Pricing 1: 1=0.10000, 10=0.01500, 100=0.00610, 1000=0.00275, 2500=0.00239, 5000=0.00197 (USD); Case/Package: 0402; Case Code (Metric): 1005; Case Code (Imperial): 0402; Size Code: 0402; Min Operating Temperature: -55°C; Max Operating Temperature: 155°C; Resistor Type: Thick Film; Package Quantity: 1; Tolerance: 1%; Packaging: Tape and Reel; Number of Terminations: 2; Termination: SMD/SMT; Features: Moisture Resistant; Series: RC; Resistance Tolerance: 1%; Construction: Rectangular; Technology: THICK FILM; Length: 1mm; Width: 0.02inch; Height: 0.016inch; Depth: 0.5mm; RoHS Compliant: Yes; REACH SVHC: No SVHC; Military Standard: Not; Lead Free: Lead Free; ComponentLink1URL: https://datasheet.ciiva.com/11808/0900766b80c66297-11808238.pdf?src-supplier=RSComponents; ComponentLink1Description: https://datasheet.ciiva.com/11808/0900766b80c66297-11808238.pdf?src-supplier=RSComponents; ComponentLink2URL: https://datasheet.ciiva.com/46394/1018594-46394950.pdf?src-supplier=Element14; ComponentLink2Description: https://datasheet.ciiva.com/46394/1018594-46394950.pdf?src-supplier=Element14; ComponentLink3URL: https://datasheet.ciiva.com/2453/pyu-r-int-thick-7-2453440.pdf?src-supplier=Digi-Key; ComponentLink3Description: https://datasheet.ciiva.com/2453/pyu-r-int-thick-7-2453440.pdf?src-supplier=Digi-Key; ComponentLink4URL: https://datasheet.ciiva.com/2453/pyu-r-int-thick-7-2453441.pdf?src-supplier=Digi-Key; ComponentLink4Description: https://datasheet.ciiva.com/2453/pyu-r-int-thick-7-2453441.pdf?src-supplier=Digi-Key; ComponentLink5URL: https://datasheet.ciiva.com/2453/pyu-r-int-thick-7-2453439.pdf?src-supplier=Digi-Key; ComponentLink5Description: https://datasheet.ciiva.com/2453/pyu-r-int-thick-7-2453439.pdf?src-supplier=Digi-Key; ComponentLink6URL: https://datasheet.ciiva.com/12558/pyu-rc0402-51-rohs-l-6-r-8721-12558542.pdf?src-supplier=Mouser; ComponentLink6Description: https://datasheet.ciiva.com/12558/pyu-rc0402-51-rohs-l-6-r-8721-12558542.pdf?src-supplier=Mouser; ComponentLink7URL: https://datasheet.ciiva.com/7849/1018594-7849863.pdf?src-supplier=Element14; ComponentLink7Description: https://datasheet.ciiva.com/7849/1018594-7849863.pdf?src-supplier=Element14; ComponentLink8URL: https://datasheet.ciiva.com/7849/1018594-7849864.pdf?src-supplier=Element14; ComponentLink8Description: https://datasheet.ciiva.com/7849/1018594-7849864.pdf?src-supplier=Element14; ComponentLink9URL: https://datasheet.ciiva.com/15189/getdatasheetpartid-323992-15189370.pdf?src-supplier=Verical; ComponentLink9Description: https://datasheet.ciiva.com/15189/getdatasheetpartid-323992-15189370.pdf?src-supplier=Verical; Supplier Part Number 1: 311-1.50KLRCT-ND; LCSC Part Number: C114759
R22 = RC0201FR-0710KL: RES SMD 10K OHM 1% 1/20W 0201; Manufacturer: Yageo; Item Type: Resistor; Manufacturer Part Number: RC0201FR-0710KL; Package: 0201; ComponentLink7Description: LCSC; ComponentLink7URL: https://www.lcsc.com/product-detail/Chip-Resistor-Surface-Mount_YAGEO-RC0201FR-0710KL_C106225.html; LCSC Part Number: C106225
R47 = RC1210JR-072RL: RES 2 OHM 5% 1/2W 1210; Manufacturer: Yageo; Power Rating: 500mW; Voltage Rating: 200V; Temperature Coefficient: 200ppm/°C; Supplier 1: Mouser; Manufacturer Part Number: RC1210JR-072RL; RoHS: Yes; Category: Chip SMD Resistors; Stock 1: 3816; Pricing 1: 1=0.29000, 10=0.25000, 50=0.25000, 100=0.09800, 1000=0.04800, 10000=0.03200 (USD); Case/Package: 1210; Case Code (Imperial): 1210; Case Code (Metric): 3225; Min Operating Temperature: -55°C; Max Operating Temperature: 155°C; Resistance: 2R; Tolerance: 5%; Packaging: Tape and Reel; Resistor Type: Thick Film; Termination: SMD/SMT; Number of Terminations: 2; Max Power Dissipation: 500mW; Features: Moisture Resistant; Series: RC; Construction: Rectangular; Length: 3.1mm; Width: 2.6mm; Height: 0.024inch; Depth: 2.6mm; Military Standard: Not; Lead Free: Lead Free; RoHS Compliant: Yes; ComponentLink1URL: https://datasheet.ciiva.com/16741/pyu-rc1210-51-rohs-l-4-16741479.pdf?src-supplier=Future+Electronics; ComponentLink1Description: https://datasheet.ciiva.com/16741/pyu-rc1210-51-rohs-l-4-16741479.pdf?src-supplier=Future+Electronics; Supplier Part Number 1: 603-RC1210JR-072RL; LCSC Part Number: C114691
R48 = RC0805FR-070RL: RES 0 OHM JUMPER 1/8W 0805; Manufacturer: Yageo; Resistance: 0mR; Tolerance: 1%; Power Rating: 125mW; Item Type: Resistor; Supplier 1: Avnet; Manufacturer Part Number: RC0805FR-070RL; RoHS: Yes; Category: Chip SMD Resistors; Stock 1: 85000; Pricing 1: 5000=0.00281, 10000=0.00277, 20000=0.00269 (USD); Case/Package: 0805; Contact Plating: Tin,Matte; Case Code (Imperial): 0805; Case Code (Metric): 2012; Size Code: 0805; Min Operating Temperature: -55°C; Max Operating Temperature: 155°C; Resistor Type: Thick Film; Packaging: Tape and Reel; Features: Moisture Resistant; Series: RC; Max Power Dissipation: 125mW; Number of Terminations: 2; Construction: Rectangular; Length: 2mm; Depth: 1.25mm; Radiation Hardening: No; Military Standard: Not; Lead Free: Lead Free; RoHS Compliant: Yes; ComponentLink1URL: https://datasheet.ciiva.com/15189/getdatasheetpartid-348154-15189885.pdf?src-supplier=Verical; ComponentLink1Description: https://datasheet.ciiva.com/15189/getdatasheetpartid-348154-15189885.pdf?src-supplier=Verical; ComponentLink2URL: https://datasheet.ciiva.com/17042/rc0805-17042698.pdf?src-supplier=Future+Electronics; ComponentLink2Description: https://datasheet.ciiva.com/17042/rc0805-17042698.pdf?src-supplier=Future+Electronics; Supplier Part Number 1: RC0805FR-070RL; LCSC Part Number: C100045
R? = RC0603FR-0710KL: RES SMD 10K Ohm 1% 1/10W 0603; Manufacturer: Yageo; Resistance: 10kR; Temperature Coefficient: 100ppm/°C; Voltage Rating (DC): 50V; Power Rating: 100mW; Voltage Rating: 75V; Item Type: Resistor; Supplier 1: Digi-Key; Manufacturer Part Number: RC0603FR-0710KL; RoHS: Yes; Category: Chip SMD Resistors; Stock 1: 25249139; Pricing 1: 1=0.10000, 10=0.02400, 100=0.00970, 1000=0.00436, 2500=0.00378 (USD); Case/Package: 0603; Number of Pins: 2; Case Code (Imperial): 0603; Case Code (Metric): 1608; Weight: 7.1E-05oz; Size Code: 0603; Min Operating Temperature: -55°C; Max Operating Temperature: 155°C; Tolerance: 1%; Resistor Type: Thick Film; Packaging: Tape and Reel; Termination: SMD/SMT; Features: Moisture Resistant; Series: RC; Max Power Dissipation: 100mW; Number of Terminations: 2; Resistance Tolerance: 1%; Construction: Rectangular; Length: 1.6mm; Width: 0.8mm; Height: 0.45mm; Depth: 0.8mm; Lead Pitch: 0.3mm; REACH SVHC: Unknown; Lead Free: Lead Free; Military Standard: Not; RoHS Compliant: Yes; ComponentLink1URL: https://datasheet.ciiva.com/7660/38590-7660789.pdf?src-supplier=Element14; ComponentLink1Description: https://datasheet.ciiva.com/7660/38590-7660789.pdf?src-supplier=Element14; ComponentLink2URL: https://datasheet.ciiva.com/7983/443971-7983596.pdf?src-supplier=Element14; ComponentLink2Description: https://datasheet.ciiva.com/7983/443971-7983596.pdf?src-supplier=Element14; ComponentLink3URL: https://datasheet.ciiva.com/22747/443971-22747519.pdf?src-supplier=Element14; ComponentLink3Description: https://datasheet.ciiva.com/22747/443971-22747519.pdf?src-supplier=Element14; ComponentLink4URL: https://datasheet.ciiva.com/46440/1868787-46440891.pdf?src-supplier=Element14; ComponentLink4Description: https://datasheet.ciiva.com/46440/1868787-46440891.pdf?src-supplier=Element14; ComponentLink5URL: https://datasheet.ciiva.com/7746/1738695-7746239.pdf?src-supplier=Element14; ComponentLink5Description: https://datasheet.ciiva.com/7746/1738695-7746239.pdf?src-supplier=Element14; ComponentLink6URL: https://datasheet.ciiva.com/15189/getdatasheetpartid-409289-15189591.pdf?src-supplier=Verical; ComponentLink6Description: https://datasheet.ciiva.com/15189/getdatasheetpartid-409289-15189591.pdf?src-supplier=Verical; Supplier Part Number 1: 311-10.0KHRCT-ND; LCSC Part Number: C98220
U1 U2 = CSD17313Q2: 30V 5A 2.3W 30mΩ@4A,8V null WSON-6 MOSFETs ROHS; Manufacturer: Texas Instruments; Item Type: IC; Supplier: Mouser; Supplier Part Number: 595-CSD17313Q2; Manufacturer Part Number: CSD17313Q2; RoHS: Yes; Category: MOSFETs; Stock: 12528; Pricing: 1=0.59, 10=0.502, 50=0.502, 100=0.375, 1000=0.228, 10000=0.156 (USD); ComponentLink1URL: https://datasheet.ciiva.com/6388/csd17313q2-6388183.pdf?src-supplier=Digi-Key; ComponentLink1Description: https://datasheet.ciiva.com/6388/csd17313q2-6388183.pdf?src-supplier=Digi-Key; ComponentLink2URL: https://datasheet.ciiva.com/4438/slps260b-128048-4438543.pdf?src-supplier=Mouser; ComponentLink2Description: https://datasheet.ciiva.com/4438/slps260b-128048-4438543.pdf?src-supplier=Mouser; ComponentLink3URL: https://datasheet.ciiva.com/1255/csd17313q2-1255358.pdf?src-supplier=Newark; ComponentLink3Description: https://datasheet.ciiva.com/1255/csd17313q2-1255358.pdf?src-supplier=Newark; ComponentLink4URL: https://datasheet.ciiva.com/7968/1536237-7968249.pdf?src-supplier=Element14; ComponentLink4Description: https://datasheet.ciiva.com/7968/1536237-7968249.pdf?src-supplier=Element14; LCSC Part Number: C2863837
U3 = CSD25310Q2: MOSFET P-CH 20V 48A 6SON; Manufacturer: Texas Instruments; Supplier: Mouser; Supplier Part Number: 595-CSD25310Q2; Manufacturer Part Number: CSD25310Q2; RoHS: Yes; Category: Integrated Circuits (ICs); Stock: 10899; Pricing: 1=0.51, 10=0.438, 50=0.438, 100=0.327, 1000=0.198, 10000=0.136 (USD); ComponentLink1URL: https://datasheet.ciiva.com/29747/csd25310q2-29747573.pdf?src-supplier=Digi-Key; ComponentLink1Description: https://datasheet.ciiva.com/29747/csd25310q2-29747573.pdf?src-supplier=Digi-Key; LCSC Part Number: C468254; Item Type: Mosfet
U4 = BQ24133RGYR: IC BATT CHG LI-ION 1-3CEL 24VQFN; Manufacturer: Texas Instruments; Supplier: Mouser; Supplier Part Number: 595-BQ24133RGYR; Manufacturer Part Number: BQ24133RGYR; RoHS: Yes; Category: Battery Management; Stock: 4511; Pricing: 1=3.03, 10=2.73, 50=2.73, 100=2.24, 1000=1.61, 10000=1.52 (USD); ComponentLink1URL: https://datasheet.ciiva.com/15115/getdatasheetpartid-543747-15115273.pdf?src-supplier=Verical; ComponentLink1Description: https://datasheet.ciiva.com/15115/getdatasheetpartid-543747-15115273.pdf?src-supplier=Verical; ComponentLink2URL: https://datasheet.ciiva.com/1934/bq24133-1934706.pdf?src-supplier=Digi-Key; ComponentLink2Description: https://datasheet.ciiva.com/1934/bq24133-1934706.pdf?src-supplier=Digi-Key; ComponentLink3URL: https://datasheet.ciiva.com/3214/bq24133-3214134.pdf?src-supplier=Avnet; ComponentLink3Description: https://datasheet.ciiva.com/3214/bq24133-3214134.pdf?src-supplier=Avnet; LCSC Part Number: C44478; Item Type: IC